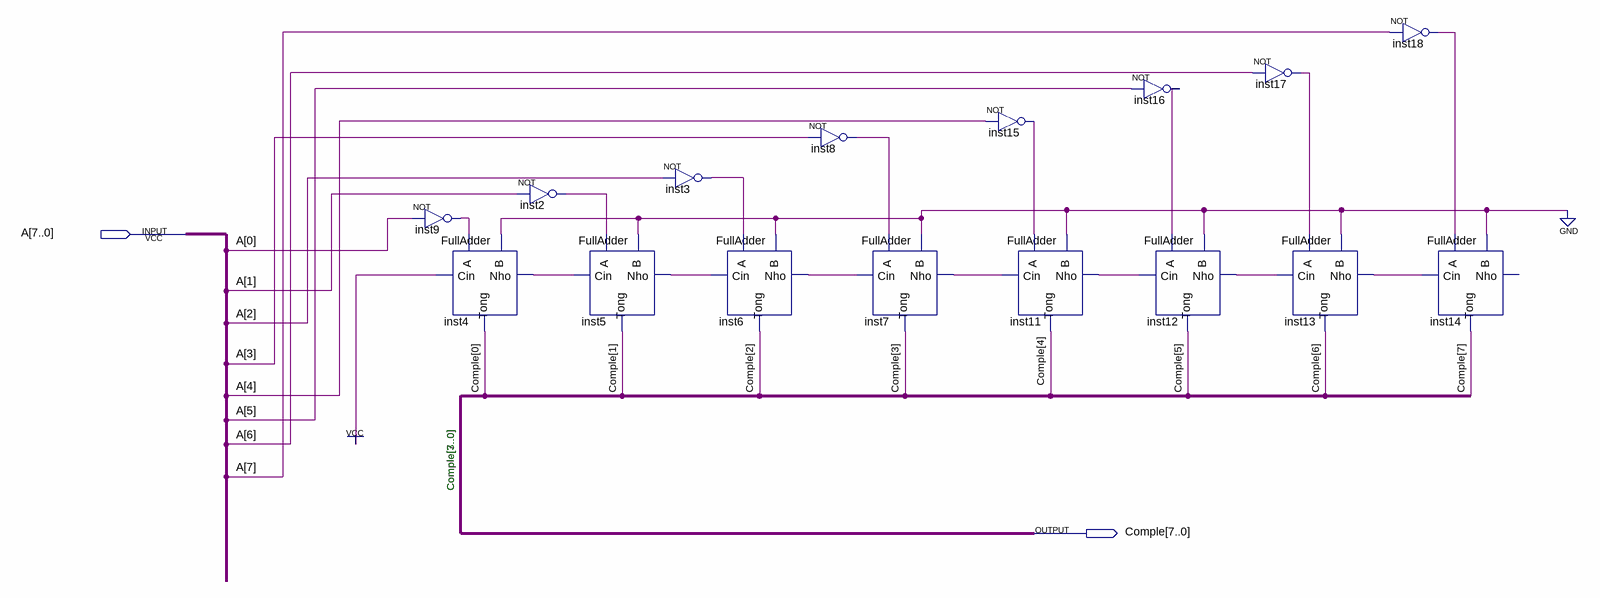
[diagram p0: schematic sheet]
// Quartus schematic Bu_2.bdf as structural Verilog: 16 symbols, 2 pins
module Bu_2 (
  input  [7:0] A,
  output [7:0] Comple
);

  wire inst2_out, inst3_out, inst4_nho, inst5_nho, inst6_nho, inst7_nho, inst8_out, inst9_out, inst11_nho,
       inst12_nho, inst13_nho, inst15_out, inst16_out, inst17_out, inst18_out;

  not inst9 (inst9_out, A[0]);
  FullAdder inst4 (.Cin(1'b1), .A(inst9_out), .B(1'b0), .Tong(Comple[0]), .Nho(inst4_nho));
  not inst2 (inst2_out, A[1]);
  FullAdder inst5 (.Cin(inst4_nho), .A(inst2_out), .B(1'b0), .Tong(Comple[1]), .Nho(inst5_nho));
  not inst3 (inst3_out, A[2]);
  FullAdder inst6 (.Cin(inst5_nho), .A(inst3_out), .B(1'b0), .Tong(Comple[2]), .Nho(inst6_nho));
  not inst8 (inst8_out, A[3]);
  FullAdder inst7 (.Cin(inst6_nho), .A(inst8_out), .B(1'b0), .Tong(Comple[3]), .Nho(inst7_nho));
  not inst15 (inst15_out, A[4]);
  FullAdder inst11 (.Cin(inst7_nho), .A(inst15_out), .B(1'b0), .Tong(Comple[4]), .Nho(inst11_nho));
  not inst16 (inst16_out, A[5]);
  FullAdder inst12 (.Cin(inst11_nho), .A(inst16_out), .B(1'b0), .Tong(Comple[5]), .Nho(inst12_nho));
  not inst17 (inst17_out, A[6]);
  FullAdder inst13 (.Cin(inst12_nho), .A(inst17_out), .B(1'b0), .Tong(Comple[6]), .Nho(inst13_nho));
  not inst18 (inst18_out, A[7]);
  FullAdder inst14 (.Cin(inst13_nho), .A(inst18_out), .B(1'b0), .Tong(Comple[7]));  // open: Nho

  // Notes on the sheet:
  //   Comple[3..0]
endmodule
